# Altium schematic sheet IDC_Tester_v1_mcu.SchDoc
size A4; SheetNumber: 1; SheetTotal: 10
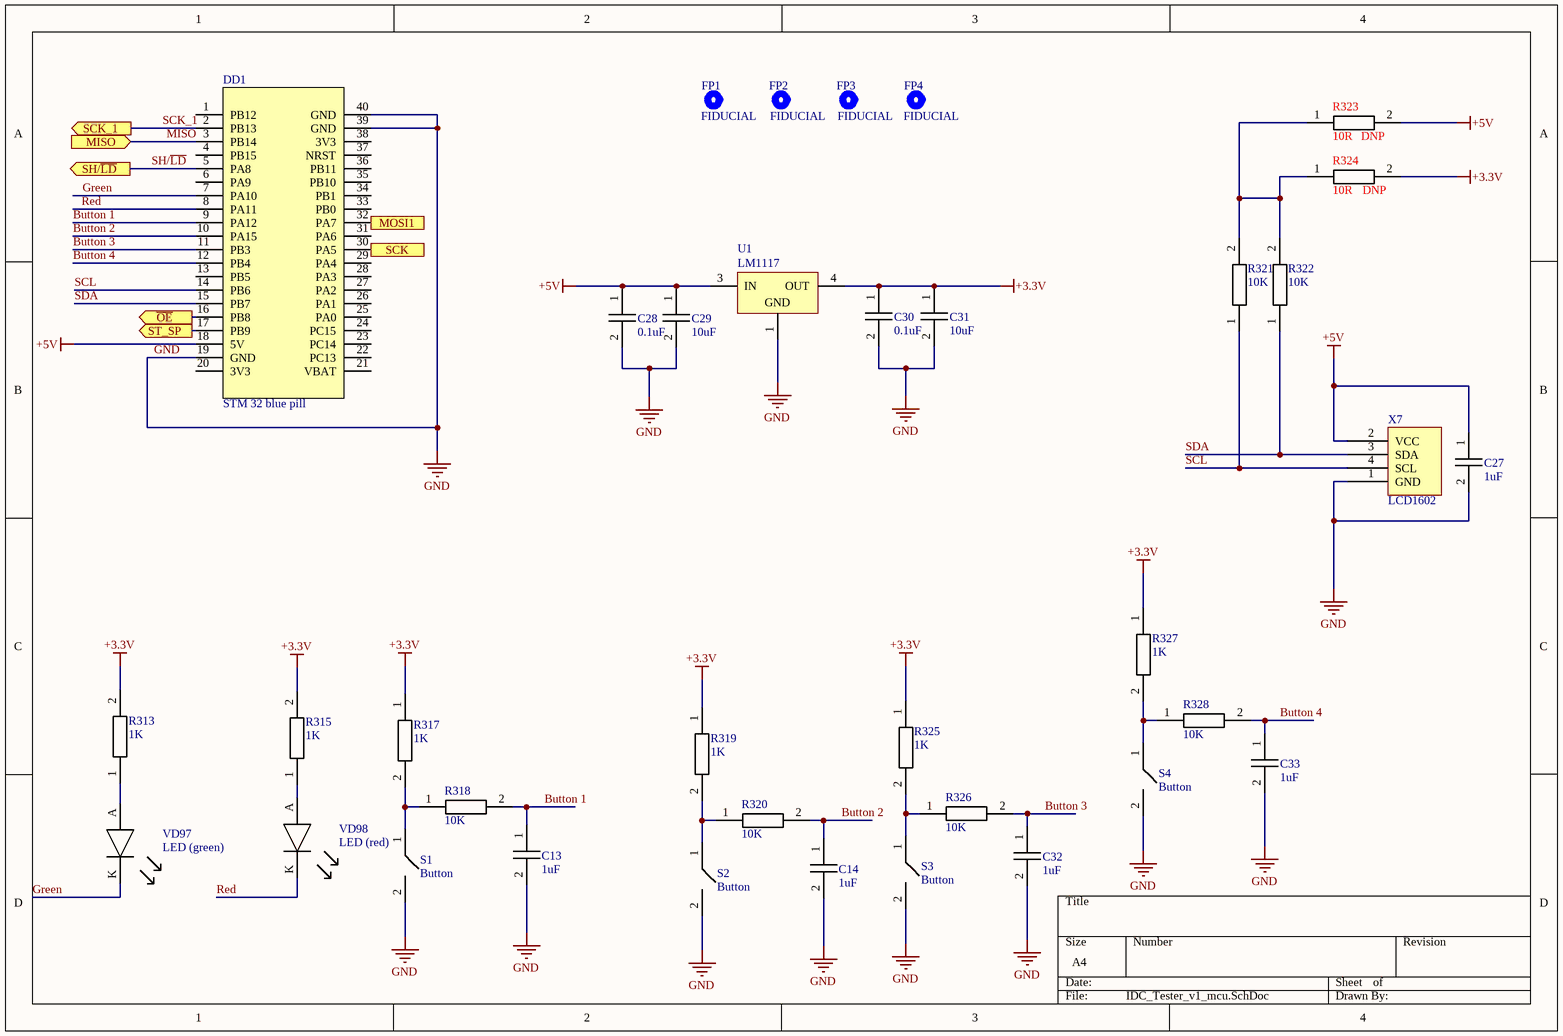
[diagram p0: IDC_Tester_v1_mcu.SchDoc]

## Parts
C13  1uF  [Capacitor 0603]
C14  1uF  [Capacitor 0603]
C27  1uF  [Capacitor 0603]
C28  0.1uF  [Capacitor 0603]
C29  10uF  [Capacitor 0603]
C30  0.1uF  [Capacitor 0603]
C31  10uF  [Capacitor 0603]
C32  1uF  [Capacitor 0603]
C33  1uF  [Capacitor 0603]
DD1  STM 32 blue pill  [STM32 blue pill]
FP1  FIDUCIAL  [FIDICIAL POINT - R0.3]
FP2  FIDUCIAL  [FIDICIAL POINT - R0.3]
FP3  FIDUCIAL  [FIDICIAL POINT - R0.3]
FP4  FIDUCIAL  [FIDICIAL POINT - R0.3]
R313  1K  [Resistor 0603]
R315  1K  [Resistor 0603]
R317  1K  [Resistor 0603]
R318  10K  [Resistor 0603]
R319  1K  [Resistor 0603]
R320  10K  [Resistor 0603]
R321  10K  [Resistor 0603]
R322  10K  [Resistor 0603]
R323  10R  Mount: DNP  [Resistor 0603]
R324  10R  Mount: DNP  [Resistor 0603]
R325  1K  [Resistor 0603]
R326  10K  [Resistor 0603]
R327  1K  [Resistor 0603]
R328  10K  [Resistor 0603]
S1  Button  [Button]
S2  Button  [Button]
S3  Button  [Button]
S4  Button  [Button]
U1  LM1117  [TO-252]
VD97  LED (green)  [Led 0603 green]
VD98  LED (red)  [Led 0603 RED]
X7  LCD1602  [LCD1602]

## Ports
MISO (in), MOSI1 (out), SCK (out), SCK_1 (out), SH/~{LD} (out), ST_SP (out), ~{OE} (out)

## Nets
+3.3V: C30.1 C31.1 R313.2 R315.2 R317.1 R319.1 R324.2 R325.1 R327.1 U1.4(OUT)
+5V: C27.1 C28.1 C29.1 DD1.18(5V) R323.2 U1.3(IN) X7.2(VCC)
GND: C13.2 C14.2 C27.2 C28.2 C29.2 C30.2 C31.2 C32.2 C33.2 DD1.19(GND) DD1.39(GND) DD1.40(GND) S1.2 S2.2 S3.2 S4.2 U1.1(GND) X7.1(GND)
Button 1: C13.1 DD1.9(PA12) R318.2
Button 2: C14.1 DD1.10(PA15) R320.2
Button 3: C32.1 DD1.11(PB3) R326.2
Button 4: C33.1 DD1.12(PB4) R328.2
Green: DD1.7(PA10) VD97.K
MISO: DD1.3(PB14) ; port MISO
MOSI1: DD1.32(PA7) ; port MOSI1
~{OE}: DD1.16(PB8) ; port ~{OE}
Red: DD1.8(PA11) VD98.K
SCK: DD1.30(PA5) ; port SCK
SCK_1: DD1.2(PB13) ; port SCK_1
SCL: DD1.14(PB6) R321.1 X7.4(SCL)
SDA: DD1.15(PB7) R322.1 X7.3(SDA)
SH/~{LD}: DD1.5(PA8) ; port SH/~{LD}
ST_SP: DD1.17(PB9) ; port ST_SP
NetR313_1: R313.1 VD97.A
NetR315_1: R315.1 VD98.A
NetR317_2: R317.2 R318.1 S1.1
NetR319_2: R319.2 R320.1 S2.1
NetR321_2: R321.2 R322.2 R323.1 R324.1
NetR325_2: R325.2 R326.1 S3.1
NetR327_2: R327.2 R328.1 S4.1

Not connected (* = marked no-connect by the designer): DD1 1(PB12) 4(PB15) 6(PA9) 13(PB5) 20(3V3) 21(VBAT) 22(PC13) 23(PC14) 24(PC15) 25(PA0) 26(PA1) 27(PA2) 28(PA3) 29(PA4) 31(PA6) 33(PB0) 34(PB1) 35(PB10) 36(PB11) 37(NRST) 38(3V3)

## Library data of the parts
C13 C14 C27 C32 C33 = Capacitor: Part Number: SMD CAP CER 1UF 25V X5R 0603 (CC0603KRX5R8BB105); Added by: viskov2055@gmail.com; Mount_Type: SMD; Solder_Amount: 2; Pkg: 0603; Created at: 16/02/2024; Mount: MOUNT
C28 C30 = C0603_2: Capacitor SMD 0603; Part Number: CAP CER 0603 0.1uF 16V 10%; Added_by: ridel_av@teslatec.ru; Solder_Amount: 2; Pkg: 0603; Mount: MOUNT; MountType: SMD
C29 C31 = C0603_3: Capacitor SMD 0603; Part Number: CAP CER 0603 10uF 16V 10%; Added_by: ridel_av@teslatec.ru; Solder_Amount: 2; Pkg: 0603; Mount: MOUNT; MountType: SMD
DD1 = STM 32 blue pill: Part Number: STM32F103C8T6 (blue pill); Added by: viskov2055@gmail.com; Mount_Type: THM; Solder_Amount: 40; Pkg: PBS-40 (STM32 blue pill); Created at: 13/02/2024; Mount: MOUNT
FP1-FP4 = FIDUCIAL_R0.3: Adder_by: ridel_av@teslatec.ru; Solder_Amount: -; Pkg: -; Created_at: 22/03/2020; Mount: -; MountType: -
R313 R315 R317 R319 R325 R327 = Resistor 1K: Part Number: SMD RES 1K OHM 1%±100ppm/°C 0603 (RMCF0603FT1K00); Added by: viskov2055@gmail.com; Mount_Type: SMD; Solder_Amount: 2; Pkg: 0603; Created at: 13/02/2024; Mount: MOUNT
R318 R320-R322 R326 R328 = Resistor 10K: Part Number: SMD RES 10K OHM 1%±100ppm/°C 0603 (RMCF0603FT10K0); Added by: viskov2055@gmail.com; Mount_Type: SMD; Solder_Amount: 2; Pkg: 0603; Created at: 15/02/2024; Mount: MOUNT
R323 R324 = Resistor 10R: Part Number: SMD RES 10 OHM 1% ±100ppm/°C 0603 (RMCF0603FT10R); Added by: viskov2055@gmail.com; Mount_Type: SMD; Solder_Amount: 2; Pkg: 0603; Created at: 19/02/2024
S1-S4 = Button: Part Number: PTS645SM43SMTR92LFS; Added by: viskov2055@gmail.com; Mpunt_Type: SMD; Solder_Amount: 4; Created at: 19/02/2024; Mount: MOUNT; Pkg: Button
U1 = LM1117DT-3.3/NOPB: 800mA Low-Dropout Linear Regulator, 3-pin TO-252, Pb-Free; Added_by: ridel_av@teslatec.ru; Solder_Amount: 3; Pkg: TD03B_N; Mount: MOUNT; MountType: SMD; Part Number: LM1117DT-3.3/NOPB
VD97 = LED: LED Uni-Color Green 515nm 2-Pin SMD T/R; Manufacturer: Kingbright; Manufacturer Part Number: APG1608ZGCK; Lens Style: Flat; Lens Transparency: Clear; Luminous Intensity: 400mcd; Forward Voltage: 3.3V; Test Current: 20mA; Viewing Angle: 130°; Dominant Wavelength: 525nm; Lens Size: 0.8mm; Added by: viskov2055@gmail.com; Solder_Amount: 2; Pkg: 0603; RoHS: Yes; Category: LEDs; Stock 1: 44996; Pricing 1: 1=0,6, 10=0,368, 100=0,2114, 1000=0,16544, 2000=0,15165 (USD); MountType: SMD; Case/Package: 0603; Color: Green; Case Code (Imperial): 0603; Case Code (Metric): 1608; Packaging: Tape and Reel; Length: 1.6mm; Width: 0.8mm; Height: 0.28mm; RoHS Compliant: Yes; ComponentLink1URL: https://datasheet.octopart.com/APG1608ZGCK-Kingbright-datasheet-153682089.pdf?src-supplier=Future+Electronics; ComponentLink1Description: https://datasheet.octopart.com/APG1608ZGCK-Kingbright-datasheet-153682089.pdf?src-supplier=Future+Electronics; ComponentLink2URL: http://www.kingbrightusa.com/images/catalog/SPEC/APG1608ZGCK.pdf?src-supplier=Digikey; ComponentLink2Description: http://www.kingbrightusa.com/images/catalog/SPEC/APG1608ZGCK.pdf?src-supplier=Digikey; ComponentLink3URL: https://datasheet.octopart.com/APG1608ZGCK-Kingbright-datasheet-137408059.pdf?src-supplier=Sager+Electronics; ComponentLink3Description: https://datasheet.octopart.com/APG1608ZGCK-Kingbright-datasheet-137408059.pdf?src-supplier=Sager+Electronics; Supplier Part Number 1: 754-2113-1-ND; Created at: 13/02/2024; Mount: MOUNT; Part Number: APG1608ZGCK; Supplier 1: Digikey
VD98 = LED (red): Part Number: APT1608SURCK; Added by: viskov2055@gmail.com; Solder_Amount: 2; Pkg: 0603; Mount_Type: SMD; Created at: 13/02/2024; Mount: MOUNT
X7 = LCD1602: Part Number: LCD1602I2C (green light); Added by: viskov2055@gmail.com; Mount_Type: THM; Solder_Amount: 4; Pkg: board (connector); Created at: 19/02/2024; Mount: MOUNT